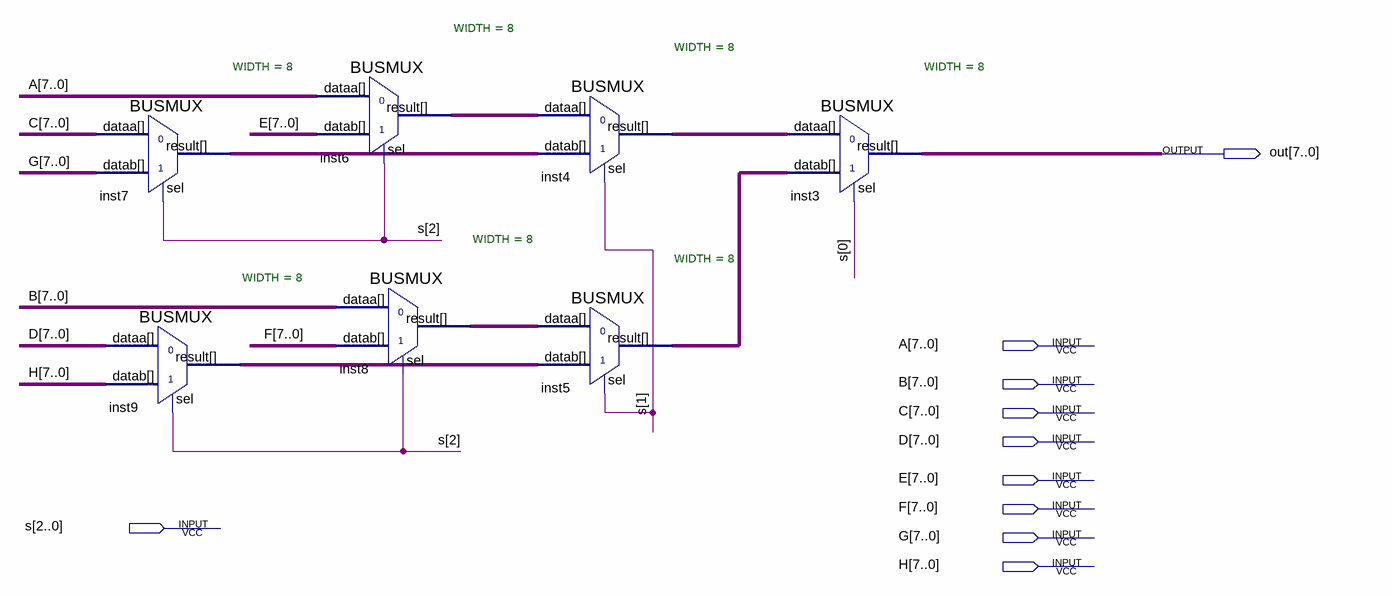
[diagram p0: schematic sheet]
// Quartus schematic 8x8bit-Mux.bdf as structural Verilog: 7 symbols, 10 pins
module \8x8bit-Mux  (
  input  [7:0] A,
  input  [7:0] B,
  input  [7:0] C,
  input  [7:0] D,
  input  [7:0] E,
  input  [7:0] F,
  input  [2:0] s,
  input  [7:0] G,
  input  [7:0] H,
  output [7:0] out
);

  wire [7:0] inst4_result, inst5_result, inst6_result, inst7_result, inst8_result, inst9_result;

  BUSMUX #(.WIDTH(8)) inst7 (.datab(G), .sel(s[2]), .dataa(C), .result(inst7_result));
  BUSMUX #(.WIDTH(8)) inst9 (.datab(H), .sel(s[2]), .dataa(D), .result(inst9_result));
  BUSMUX #(.WIDTH(8)) inst6 (.datab(E), .sel(s[2]), .dataa(A), .result(inst6_result));
  BUSMUX #(.WIDTH(8)) inst8 (.datab(F), .sel(s[2]), .dataa(B), .result(inst8_result));
  BUSMUX #(.WIDTH(8)) inst4 (.datab(inst7_result), .sel(s[1]), .dataa(inst6_result), .result(inst4_result));
  BUSMUX #(.WIDTH(8)) inst5 (.datab(inst9_result), .sel(s[1]), .dataa(inst8_result), .result(inst5_result));
  BUSMUX #(.WIDTH(8)) inst3 (.datab(inst5_result), .sel(s[0]), .dataa(inst4_result), .result(out));
endmodule
